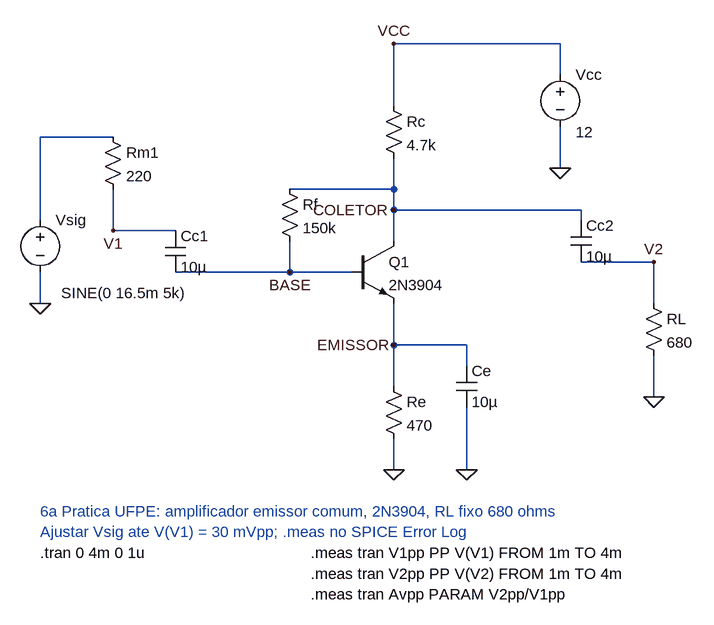
[diagram p0: schematic Pratica_06_Emissor_Comum_2N3904_Sem_Potenciometro.asc]
Pratica_06_Emissor_Comum_2N3904_Sem_Potenciometro.asc, the LTspice schematic file:
Version 4.1
SHEET 1 1312 1056
WIRE 896 64 640 64
WIRE 896 112 896 64
WIRE 640 160 640 64
WIRE 208 208 96 208
WIRE 896 256 896 192
WIRE 640 288 640 240
WIRE 640 288 480 288
WIRE 640 320 640 288
WIRE 928 320 640 320
WIRE 96 336 96 208
WIRE 928 336 928 320
WIRE 208 352 208 288
WIRE 304 352 208 352
WIRE 640 368 640 320
WIRE 1040 400 928 400
WIRE 480 416 480 368
WIRE 480 416 304 416
WIRE 576 416 480 416
WIRE 96 464 96 416
WIRE 1040 464 1040 400
WIRE 640 528 640 464
WIRE 752 528 640 528
WIRE 752 560 752 528
WIRE 640 592 640 528
WIRE 1040 608 1040 544
WIRE 640 720 640 672
WIRE 752 720 752 624
FLAG 640 64 VCC
FLAG 896 256 0
FLAG 96 464 0
FLAG 208 352 V1
FLAG 480 416 BASE
FLAG 640 320 COLETOR
FLAG 640 528 EMISSOR
FLAG 640 720 0
FLAG 752 720 0
FLAG 1040 400 V2
FLAG 1040 608 0
SYMBOL voltage 96 320 R0
WINDOW 3 32 128 Left 2
SYMATTR Value SINE(0 16.5m 5k)
SYMATTR InstName Vsig
SYMBOL res 192 192 R0
SYMATTR InstName Rm1
SYMATTR Value 220
SYMBOL cap 288 352 R0
SYMATTR InstName Cc1
SYMATTR Value 10µ
SYMBOL res 464 272 R0
SYMATTR InstName Rf
SYMATTR Value 150k
SYMBOL res 624 144 R0
SYMATTR InstName Rc
SYMATTR Value 4.7k
SYMBOL npn 576 368 R0
SYMATTR InstName Q1
SYMATTR Value 2N3904
SYMBOL res 624 576 R0
SYMATTR InstName Re
SYMATTR Value 470
SYMBOL cap 736 560 R0
SYMATTR InstName Ce
SYMATTR Value 10µ
SYMBOL cap 912 336 R0
SYMATTR InstName Cc2
SYMATTR Value 10µ
SYMBOL res 1024 448 R0
SYMATTR InstName RL
SYMATTR Value 680
SYMBOL voltage 896 96 R0
WINDOW 3 24 104 Left 2
SYMATTR Value 12
SYMATTR InstName Vcc
TEXT 96 784 Left 2 ;6a Pratica UFPE: amplificador emissor comum, 2N3904, RL fixo 680 ohms
TEXT 96 816 Left 2 ;Ajustar Vsig ate V(V1) = 30 mVpp; .meas no SPICE Error Log
TEXT 96 848 Left 2 !.tran 0 4m 0 1u
TEXT 512 848 Left 2 !.meas tran V1pp PP V(V1) FROM 1m TO 4m
TEXT 512 880 Left 2 !.meas tran V2pp PP V(V2) FROM 1m TO 4m
TEXT 512 912 Left 2 !.meas tran Avpp PARAM V2pp/V1pp

The netlist it stands for:
* Pratica_06_Emissor_Comum_2N3904_Sem_Potenciometro.asc
Vsig N001 0 SINE(0 16.5m 5k)
Rm1 N001 V1 220
Cc1 V1 BASE 10µ
Rf COLETOR BASE 150k
Rc VCC COLETOR 4.7k
Q1 COLETOR BASE EMISSOR 0 2N3904
Re EMISSOR 0 470
Ce EMISSOR 0 10µ
Cc2 COLETOR V2 10µ
RL V2 0 680
Vcc VCC 0 12
.model NPN NPN
.model PNP PNP
.lib standard.bjt
* 6a Pratica UFPE: amplificador emissor comum, 2N3904, RL fixo 680 ohms
* Ajustar Vsig ate V(V1) = 30 mVpp; .meas no SPICE Error Log
.tran 0 4m 0 1u
.meas tran V1pp PP V(V1) FROM 1m TO 4m
.meas tran V2pp PP V(V2) FROM 1m TO 4m
.meas tran Avpp PARAM V2pp/V1pp
.backanno
.end

* Results of the author's LTspice run, read from the files saved beside the schematic
* Operating Point, zero values left out:
*   V(base) = 1.613 V
*   V(coletor) = 2.604 V
*   V(emissor) = 939.6 mV
*   V(vcc) = 12 V
*   I(Rc) = 1.999 mA
*   I(Re) = 1.999 mA
*   I(Rf) = 6.609 µA
*   I(Vcc) = -1.999 mA
*   Ib(Q1) = 6.609 µA
*   Ic(Q1) = 1.993 mA
*   Ie(Q1) = -1.999 mA
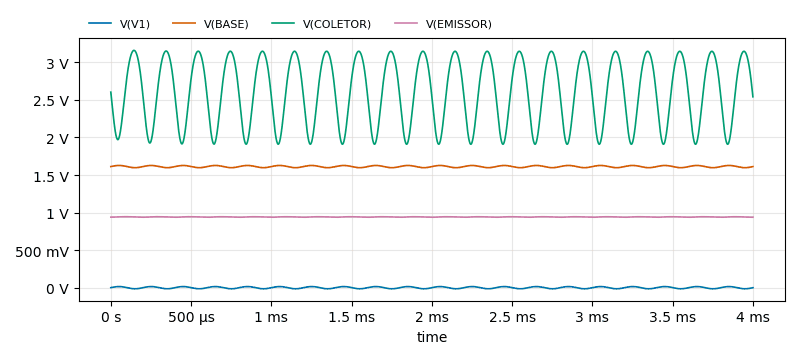
[diagram p1: Transient Analysis of Pratica_06_Emissor_Comum_2N3904_Sem_Potenciometro.asc, plotted from the saved traces]
* Transient Analysis, 1 run:
*   V(V1): min -15.02 mV, max 14.82 mV, average -6.117 µV, rms 10.5 mV, last -187.6 µV
*   V(BASE): min 1.598 V, max 1.628 V, average 1.613 V, rms 1.613 V, last 1.613 V
*   V(COLETOR): min 1.91 V, max 3.16 V, average 2.602 V, rms 2.639 V, last 2.542 V
*   V(EMISSOR): min 938 mV, max 945.4 mV, average 941.4 mV, rms 941.4 mV, last 938 mV
* From the log:
*   v1pp: PP(V(V1) )=0.0296877948567 FROM 0.001 TO 0.004
*   v2pp: PP(V(V2) )=1.23778742552 FROM 0.001 TO 0.004
*   avpp: V2pp/V1pp=41.6934781277